# Altium schematic sheet EsquematicoTGV5.SchDoc: Pcb trabajo de grado
size A4; Author: Lina Paola Diaz Caro, Nicolás Orlando Cortés Gutierrez; DrawnBy: Lina Diaz; SheetNumber: 1; SheetTotal: 1
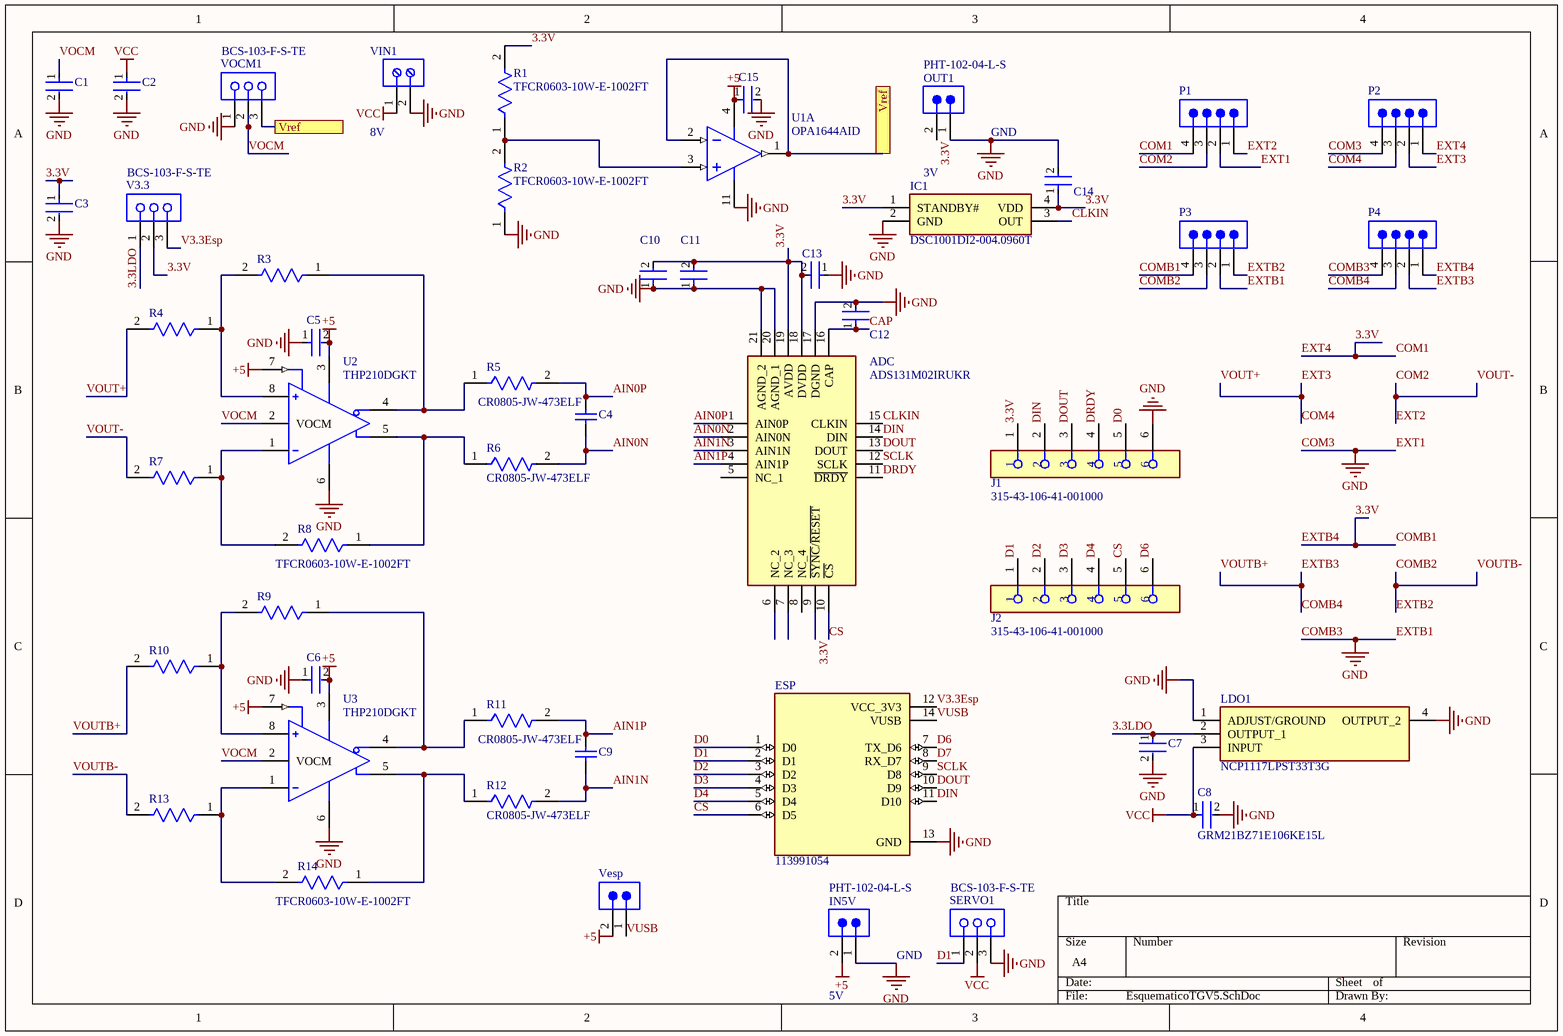
[diagram p0: EsquematicoTGV5.SchDoc]

## Parts
ADC  ADS131M02IRUKR  [QFN40P300X300X80-21N-D]
C1  CC0603KRX7R6BB104  [FP-CC0603-DA-MFG]  (value not drawn)
C2  CC0603KRX7R6BB104  [FP-CC0603-DA-MFG]  (value not drawn)
C3  CC0603KRX7R6BB104  [FP-CC0603-DA-MFG]  (value not drawn)
C4  CAP 47nF 16V 1206(3216)  [CAPC1206(3216)100_L]  (value not drawn)
C5  CC0603KRX7R6BB104  [FP-CC0603-DA-MFG]  (value not drawn)
C6  CC0603KRX7R6BB104  [FP-CC0603-DA-MFG]  (value not drawn)
C7  GRM21BZ71E106KE15L  [FP-GRM21B-0_2-e0_2_0_7-IPC_B]  (value not drawn)
C8  GRM21BZ71E106KE15L  [FP-GRM21B-0_2-e0_2_0_7-IPC_B]
C9  CAP 47nF 16V 1206(3216)  [CAPC1206(3216)100_L]  (value not drawn)
C10  CC0603KRX7R6BB104  [FP-CC0603-DA-MFG]  (value not drawn)
C11  CC0603KRX7R6BB104  [FP-CC0603-DA-MFG]  (value not drawn)
C12  CC0603KRX7R6BB104  [FP-CC0603-DA-MFG]  (value not drawn)
C13  CC0603KRX7R6BB104  [FP-CC0603-DA-MFG]  (value not drawn)
C14  CC0603KRX7R6BB104  [FP-CC0603-DA-MFG]  (value not drawn)
C15  CC0603KRX7R6BB104  [FP-CC0603-DA-MFG]  (value not drawn)
ESP  113991054  [MODULE_113991054]
IC1  DSC1001DI2-004.0960T  [DSC1001DI20040960T]
IN5V  PHT-102-04-L-S  [SMTC-PHT-102-04-X-S]
J1  315-43-106-41-001000  [FP-315-43-106-41-001000-MFG]
J2  315-43-106-41-001000  [FP-315-43-106-41-001000-MFG]
LDO1  NCP1117LPST33T3G  [SOT230P700X180-4N]
OUT1  PHT-102-04-L-S  [SMTC-PHT-102-04-X-S]
P1  TSW-104-08-G-S  [SMTC-TSW-104-08-X-S]  (value not drawn)
P2  TSW-104-08-G-S  [SMTC-TSW-104-08-X-S]  (value not drawn)
P3  TSW-104-08-G-S  [SMTC-TSW-104-08-X-S]  (value not drawn)
P4  TSW-104-08-G-S  [SMTC-TSW-104-08-X-S]  (value not drawn)
R1  TFCR0603-10W-E-1002FT  [FP-TFCR0603-IPC_B]
R2  TFCR0603-10W-E-1002FT  [FP-TFCR0603-IPC_B]
R3  TFCR0603-10W-E-1002FT  [FP-TFCR0603-IPC_B]  (value not drawn)
R4  TFCR0603-10W-E-1002FT  [FP-TFCR0603-IPC_B]  (value not drawn)
R5  CR0805-JW-473ELF  [FP-CR0805-IPC_A]
R6  CR0805-JW-473ELF  [FP-CR0805-IPC_A]
R7  TFCR0603-10W-E-1002FT  [FP-TFCR0603-IPC_B]  (value not drawn)
R8  TFCR0603-10W-E-1002FT  [FP-TFCR0603-IPC_B]
R9  TFCR0603-10W-E-1002FT  [FP-TFCR0603-IPC_B]  (value not drawn)
R10  TFCR0603-10W-E-1002FT  [FP-TFCR0603-IPC_B]  (value not drawn)
R11  CR0805-JW-473ELF  [FP-CR0805-IPC_A]
R12  CR0805-JW-473ELF  [FP-CR0805-IPC_A]
R13  TFCR0603-10W-E-1002FT  [FP-TFCR0603-IPC_B]  (value not drawn)
R14  TFCR0603-10W-E-1002FT  [FP-TFCR0603-IPC_B]
SERVO1  BCS-103-F-S-TE  [SMTC-BCS-103-X-S-TE]
U1  OPA1644AID  [D0014A_L]  (part A of 4)
U2  THP210DGKT  [FP-DGK0008A-MFG]
U3  THP210DGKT  [FP-DGK0008A-MFG]
V3.3  BCS-103-F-S-TE  [SMTC-BCS-103-X-S-TE]
Vesp  TSW-102-26-G-S  [SMTC-TSW-102-26-XX-S]  (value not drawn)
VIN1  691102710002  [691102710002]  (value not drawn)
VOCM1  BCS-103-F-S-TE  [SMTC-BCS-103-X-S-TE]

## Ports
Vref (see EsquematicoTGV5[1A]), Vref (see EsquematicoTGV5[3A])

## Nets
+5: C5.2 C6.2 C15.1 IN5V.2 U1.4(V+) U2.3(VS+) U2.7(~{PD}) U3.3(VS+) U3.7(~{PD}) Vesp.2
COM3: ADC.17(DGND) ADC.20(AGND_1) ADC.21(AGND_2) C1.2 C2.2 C3.2 C5.1 C6.1 C7.2 C8.2 C10.1 C11.1 C12.2 C13.1 C14.2 C15.2 ESP.13(GND) IC1.2(GND) IN5V.1 J1.6 LDO1.1(ADJUST/GROUND) LDO1.4(OUTPUT_2) OUT1.1 P1.2 P2.4 P3.2 P4.4 R2.1 SERVO1.3 U1.11(V-) U2.6(VS-) U3.6(VS-) VIN1.2 VOCM1.1  [also labelled COMB3, EXT1, EXTB1, GND]
VCC: C2.1 C8.1 LDO1.3(INPUT) SERVO1.2 VIN1.1
3.3LDO: C7.1 LDO1.2(OUTPUT_1) V3.3.1
3.3V: ADC.9(~{SYNC}/~{RESET}) ADC.18(DVDD) ADC.19(AVDD) C3.1 C10.2 C11.2 C13.2 C14.1 IC1.1(STANDBY#) IC1.4(VDD) J1.1 OUT1.2 P1.4 P2.1 P3.4 P4.1 R1.2 V3.3.2  [also labelled COM1, COMB1, EXT4, EXTB4]
AIN0N: ADC.2(AIN0N) C4.1 R6.2
AIN0P: ADC.1(AIN0P) C4.2 R5.2
AIN1N: ADC.3(AIN1N) C9.1 R12.2
AIN1P: ADC.4(AIN1P) C9.2 R11.2
CAP: ADC.16(CAP) C12.1
CLKIN: ADC.15(CLKIN) IC1.3(OUT)
COM2: P1.1 P1.3 R7.2  [also labelled EXT2, VOUT-]
COM4: P2.2 P2.3 R4.2  [also labelled EXT3, VOUT+]
COMB2: P3.1 P3.3 R13.2  [also labelled EXTB2, VOUTB-]
COMB4: P4.2 P4.3 R10.2  [also labelled EXTB3, VOUTB+]
CS: ADC.10(~{CS}) ESP.6(D5) J2.5
D0: ESP.1(D0) J1.5
D1: ESP.2(D1) J2.1 SERVO1.1
D2: ESP.3(D2) J2.2
D3: ESP.4(D3) J2.3
D4: ESP.5(D4) J2.4
D6: ESP.7(TX_D6) J2.6
D7: ESP.8(RX_D7)
DIN: ADC.14(DIN) ESP.11(D10) J1.2
DOUT: ADC.13(DOUT) ESP.10(D9) J1.3
DRDY: ADC.11(~{DRDY}) J1.4
SCLK: ADC.12(SCLK) ESP.9(D8)
V3.3Esp: ESP.12(VCC_3V3) V3.3.3
VOCM: C1.1 U2.2(VOCM) U3.2(VOCM) VOCM1.2
Vref: U1.1(VOUT_A) U1.2(IN_A-) VOCM1.3 ; port Vref
VUSB: ESP.14(VUSB) Vesp.1
NetR1_1: R1.1 R2.2 U1.3(IN_A+)
NetR3_1: R3.1 R5.1 U2.4(OUT+)
NetR3_2: R3.2 R4.1 U2.8(IN+)
NetR6_1: R6.1 R8.1 U2.5(OUT-)
NetR7_1: R7.1 R8.2 U2.1(IN-)
NetR9_1: R9.1 R11.1 U3.4(OUT+)
NetR9_2: R9.2 R10.1 U3.8(IN+)
NetR12_1: R12.1 R14.1 U3.5(OUT-)
NetR13_1: R13.1 R14.2 U3.1(IN-)

Not connected (* = marked no-connect by the designer): ADC 5(NC_1) 6(NC_2) 7(NC_3) 8(NC_4)

## Notes on the sheet
- (near VIN1) 8V
- (near IC1) 3V
- GND
- 5V

## Library data of the parts
ADC = ADS131M02IRUKR: Integrated Circuit; Manufacturer_Name: Texas Instruments; Datasheet Link: https://www.ti.com/lit/ds/symlink/ads131m02.pdf?ts=1623486559369&ref_url=https%253A%252F%252Fwww.ti.com%252Fstore%252Fti%252Fen%252Fp%252Fproduct%252F%253Fp%253DADS131M02IRUKR%2526keyMatch%253DADS131M02IRUKR%2526tisearch%253Dsearch-everything%2526usecase%; Height: 0.8mm; Manufacturer_Part_Number: ADS131M02IRUKR; Mouser Part Number: 595-ADS131M02IRUKR; Mouser Price/Stock: https://www.mouser.co.uk/ProductDetail/Texas-Instruments/ADS131M02IRUKR?qs=stqOd1AaK78%252BBdKjgiDOxw%3D%3D; Arrow Part Number: ADS131M02IRUKR; Arrow Price/Stock: https://www.arrow.com/en/products/ads131m02irukr/texas-instruments.html?utm_currency=USD&region=nac
C1-C3 C5 C6 C10-C15 = CMP-03422-001228-1: CAP CER 0.1UF 10V X7R 0603; Manufacturer: YAGEO; Material: Ceramic; Tolerance: 0.1; Capacitance: 100 nF; Temperature Coefficient: 15%; Value: 100 nF; Height: 0.9mm; RoHS: TRUE; Footprint Url: http://www.yageo.com/exep/pages/download/literatures/UPY-C_GEN_24.pdf; Octopart: https://octopart.com/cc0603krx7r6bb104-yageo-9291607; Device Class L1: Passive Components; Mouser Description: 0603 0.1 uF 10 V ±10 % Tolerance X7R SMT Multilayer Ceramic Capacitor; ComponentLink2URL: http://www.yageo.com/documents/recent/UPY-GPHC_X7R_6.3V-to-50V_18.pdf; Automotive: No; Voltage: 10 V; Device Class L3: Ceramic Capacitors; Category: Cap; Manufacturer Part Number: CC0603KRX7R6BB104; Temperature: -55°C to +125°C; ComponentLink2Description: Datasheet; Voltage Rating: 10 V; Device Class L2: Capacitors; Lead Free: Yes; Temperature Range High: +125°C; Temperature Range Low: -55°C; Digikey Description: CAP CER 0.1UF 10V X7R 0603; Package: CC0603-DA; Temperature Characteristic: X7R
C4 C9 = CMP-1037-03965-1: CAP 47nF 16V ±10% 1206 (3216 Metric) Thickness 1mm SMD; Tolerance: Â±10%; Case-EIA: 1206; Case-Metric: 3216; Rated Voltage: 16 V; Max Thickness: 1 mm; Value: 47nF; Technology: SMT
C7 C8 = CMP-06035-047417-1: Chip Multilayer Ceramic Capacitors for General Purpose, 0805, 10uF, X7R, 15%, 10%, 25V
ESP = 113991054: - ESP32-C3 Transceiver; 802.11 a/b/g/n (Wi-Fi, WiFi, WLAN), BluetoothÂ® Smart 4.x Low Energy (BLE) 2.4GHz Evaluation Board; MF: Seeed Technology Co., Ltd; SnapEDA_Link: https://www.snapeda.com/parts/113991054/Seeed+Studio/view-part/?ref=snap; Package: None; Value: *; MP: 113991054; Check_prices: https://www.snapeda.com/parts/113991054/Seeed+Studio/view-part/?ref=eda
IC1 = DSC1001DI2-004.0960T: Integrated Circuit; Manufacturer_Name: Microchip; Datasheet Link: https://componentsearchengine.com/Datasheets/1/DSC1001DI2-004.0960T.pdf; Height: 0.9mm; Manufacturer_Part_Number: DSC1001DI2-004.0960T; Mouser Part Number: 998-1001DI2-0040960T; Mouser Price/Stock: https://www.mouser.co.uk/ProductDetail/Microchip-Technology/DSC1001DI2-004.0960T?qs=pzVvXTvk9PyolI289D1OjQ%3D%3D
IN5V OUT1 = CMP-1024-00181-1: Press Fit Header, Through-hole, Vertical, -55 to 125 degC, 2.54 mm Pitch, 2-Pin, Male, RoHS; Manufacturer: Samtec; Pitch: 2.54 mm; PackageReference: PHT-102-04-X-S; DatasheetVersion: F-214; ComponentLink1Description: Manufacturer URL; ComponentLink3URL: http://www.samtec.com/documents/webfiles/cpdf/PHT-1XX-XX-X-X-XXX-MKT.pdf; PartNumber: PHT-102-04-L-S; Temperature Range: -55 to 125 degC; Mounting Technology: Through-hole; ComponentLink3Description: Package Specification; ComponentLink2URL: http://www.samtec.com/documents/webfiles/pdf/pht.pdf; PackageVersion: J, 9/2009; ComponentLink2Description: Datasheet; RoHS: True; Orientation: Vertical; PackageDescription: .100 Press Fit Socket Assembly; ComponentLink1URL: http://www.samtec.com
J1 J2 = CMP-00254-12081839-1: 315-43-106-41-001000 IC & Component Sockets Interconnect Socket; Number of Positions: 6; Pitch: 2.54mm; Connector Type: Receptacle, Socket; Contact Plating: Gold; NexarPartId: 12081839; Mount: Through Hole; RoHS: Compliant; Termination: Solder; Packaging: Bulk; Color: Black; Number of Rows: 1
LDO1 = NCP1117LPST33T3G: Integrated Circuit; Manufacturer_Name: onsemi; Datasheet Link: https://www.onsemi.com/pub/Collateral/NCP1117LP-D.PDF; Height: 1.8mm; Manufacturer_Part_Number: NCP1117LPST33T3G; Mouser Part Number: 863-NCP1117LPST33T3G; Mouser Price/Stock: https://www.mouser.co.uk/ProductDetail/onsemi/NCP1117LPST33T3G?qs=kbSN2QblFfKG9A4Foh4YYg%3D%3D; Arrow Part Number: NCP1117LPST33T3G; Arrow Price/Stock: https://www.arrow.com/en/products/ncp1117lpst33t3g/on-semiconductor?utm_currency=USD&region=europe
P1-P4 = CMP-1024-00357-1: 0.025" SQ Post Header, Through-hole, Vertical, -55 to 125 degC, 2.54 mm Pitch, 4-Pin, Male, RoHS; Manufacturer: Samtec; Pitch: 2.54 mm; RoHS: True; ComponentLink3URL: http://www.samtec.com/documents/webfiles/cpdf/TSW-XXX-XX-XXX-X-XX-XXX-MKT.pdf; Mounting Technology: Through-hole; ComponentLink2URL: http://www.samtec.com/documents/webfiles/pdf/TSW_TH.PDF; ComponentLink1URL: http://www.samtec.com; ComponentLink3Description: Package Specification; PackageVersion: DM, 8/1988; ComponentLink2Description: Datasheet; PackageReference: TSW-104-08-X-S; PackageDescription: .025[0.64] SQ. Post Terminal Strip Assembly; PartNumber: TSW-104-08-G-S; ComponentLink1Description: Manufacturer URL; Temperature Range: -55 to 125 degC; DatasheetVersion: F-214; Orientation: Vertical
R1-R4 R7-R10 R13 R14 = CMP-250906-152252-1: RES Thin Film,  10kΩ, 1%, 0.1W, 25ppm/°C, 0603
R5 R6 R11 R12 = CMP-07231-003309-1: Thick Film Chip Resistors 0805 47kΩ 0.125W 5% 200ppm/°C; Voltage Rating (DC): 100V; Resistance: 47kR; Power Rating: 125mW; Voltage Rating: 150V; Depth: 1.25mm; Case Code (Metric): 2012; Composition: Thick Film; Temperature Coefficient: 200ppm/°C; Number of Pins: 2; Case Code (Imperial): 0805; Case/Package: 0805; Max Operating Temperature: 155°C; Length: 2mm; Termination: SMD/SMT; Packaging: Tape and Reel; Mount: Surface Mount; Width: 1.25mm; Radiation Hardening: No; Tolerance: 5%; Height: 0.5mm; Package Quantity: 5000; Thickness: 508um; Min Operating Temperature: -55°C; Contact Plating: Tin; REACH SVHC: No SVHC; Military Standard: Not
SERVO1 V3.3 VOCM1 = CMP-1023-00006-1: Tiger Claw(TM) Pass-Through Socket, Vertical, -55 to 125 degC, 2.54 mm Pitch, 3-Pin, Female, RoHS; Manufacturer: Samtec; Pitch: 2.54 mm; DatasheetVersion: F-214; Orientation: Vertical; PartNumber: BCS-103-F-S-TE; ComponentLink2Description: Datasheet; ComponentLink3Description: Package Specification; ComponentLink1Description: Manufacturer URL; ComponentLink1URL: http://www.samtec.com; ComponentLink3URL: http://www.samtec.com/documents/webfiles/cpdf/BCS-1XX-XXX-X-XX-XXX-MKT.pdf; Temperature Range: -55 to 125 degC; RoHS: True; PackageReference: BCS-103-X-S-TE; PackageVersion: BV, 9/1991; ComponentLink2URL: http://www.samtec.com/documents/webfiles/pdf/BCS.PDF; PackageDescription: Box Connector Socket Strip; Mounting Technology: Through-hole
U1 = CMP-0808-00006-2: SoundPLUS(TM) High-Performance, JFET-Input Audio Operational Amplifier, 4.5 to 36 V, -40 to 85 degC, 14-pin SOIC (D14), Green (RoHS & no Sb/Br); Manufacturer: Texas Instruments; GBW(Typ)(MHz): 11; Vmin(V): 5; Iq per channel(Max)(mA): 2.3; Number of Channels: 4; Vmax(V): 36; Vn at Flatband(Typ)(nV/rtHz): 5.1; ComponentLink3Description: Package Specification; Code_JEDEC: MS-012; Mounting Technology: Surface Mount; Eco-Plan: Green (RoHS & no Sb/Br); ComponentLink1Description: Manufacturer URL; DatasheetVersion: SBOS484B; SubFamily: Audio Operational Amplifier; PackageDescription: 14-Pin Plastic Small Outline, Body 8.65 x 3.9 mm, Pitch 1.27 mm; ComponentLink1URL: http://www.ti.com/; PartNumber: OPA1644AID; PackageReference: D0014A; ComponentLink2Description: Datasheet; PackageVersion: 4040047-5/M, 06/2011; ComponentLink2URL: http://www.ti.com/general/docs/lit/getliterature.tsp?genericPartNumber=OPA1644&fileType=pdf; ComponentLink3URL: http://www.ti.com/lit/ml/mpds177g/mpds177g.pdf
U2 U3 = CMP-00370-109417754-1: THP210DGKT Op Amp Single Precision Amplifier ±18V/36V 8-Pin VSSOP T/R; Manufacturer Lifecycle Status: ACTIVE; Response Time: 1.2µs; Nominal Supply Current: 950µA; Input Offset Voltage (Vos): 10µV; Voltage Gain: 120dB; Min Supply Voltage: 3V; Bandwidth: 7MHz; Max Junction Temperature (Tj): 175°C; Max Dual Supply Voltage: 18V; Input Bias Current: 200pA; Output Current per Channel: 31mA; Min Dual Supply Voltage: 1.5V; Number of Channels: 1; Max Supply Voltage: 36V; Ambient Temperature Range High: 125°C; Thickness: 970µm; Case/Package: VSSOP; Width: 3mm; Height: 1.07mm; Length: 3mm; Max Operating Temperature: 125°C; Lifecycle Status: Production; Number of Pins: 8; Min Operating Temperature: -40°C; NexarPartId: 109417754
Vesp = CMP-1024-00327-1: 0.025" SQ Post Header, Through-hole, Vertical, -55 to 125 degC, 2.54 mm Pitch, 2-Pin, Male, RoHS; Manufacturer: Samtec; Pitch: 2.54 mm; Orientation: Vertical; ComponentLink3Description: Package Specification; PackageReference: TSW-102-26-XX-S; Mounting Technology: Through-hole; ComponentLink2Description: Datasheet; ComponentLink1URL: http://www.samtec.com; DatasheetVersion: F-214; ComponentLink1Description: Manufacturer URL; RoHS: True; ComponentLink2URL: http://www.samtec.com/documents/webfiles/pdf/TSW_TH.PDF; PartNumber: TSW-102-26-G-S; ComponentLink3URL: http://www.samtec.com/documents/webfiles/cpdf/TSW-XXX-XX-XXX-X-XX-XXX-MKT.pdf; PackageDescription: .025[0.64] SQ. Post Terminal Strip Assembly; PackageVersion: DM, 8/1988; Temperature Range: -55 to 125 degC
VIN1 = CMP-1502-03258-3: 102 Series 5MM Pitch Straight, Pcb Terminal Block, Through Hole, 2 Way; Current Rating: 15A; Wire/Cable Gauge: 22AWG; Voltage: 300V; Number of Positions Per Level: 2; Plating: Steel; Stripping Length: -6mm; Wire Gauge (Min): 14AWG; Number of Levels: 1; Pitch: 5.0038mm; Width: 11.2mm; Max Operating Temperature: 105°C; Contact Material: Brass; Contact Plating: Tin; Current: 15A; Wire Gauge (Max): 22AWG; Mount: Through Hole; Length: 7.5mm; Min Operating Temperature: -40°C; RoHS: Compliant; Color: Blue; Number of Pins: 2; Housing Material: Nylon; Termination: Screw; Height: 13.4mm; Number of Contacts: 2; Lead Pitch: 5mm; Voltage Rating: 300V; Packaging: Box